# Altium schematic sheet power.SchDoc
size B
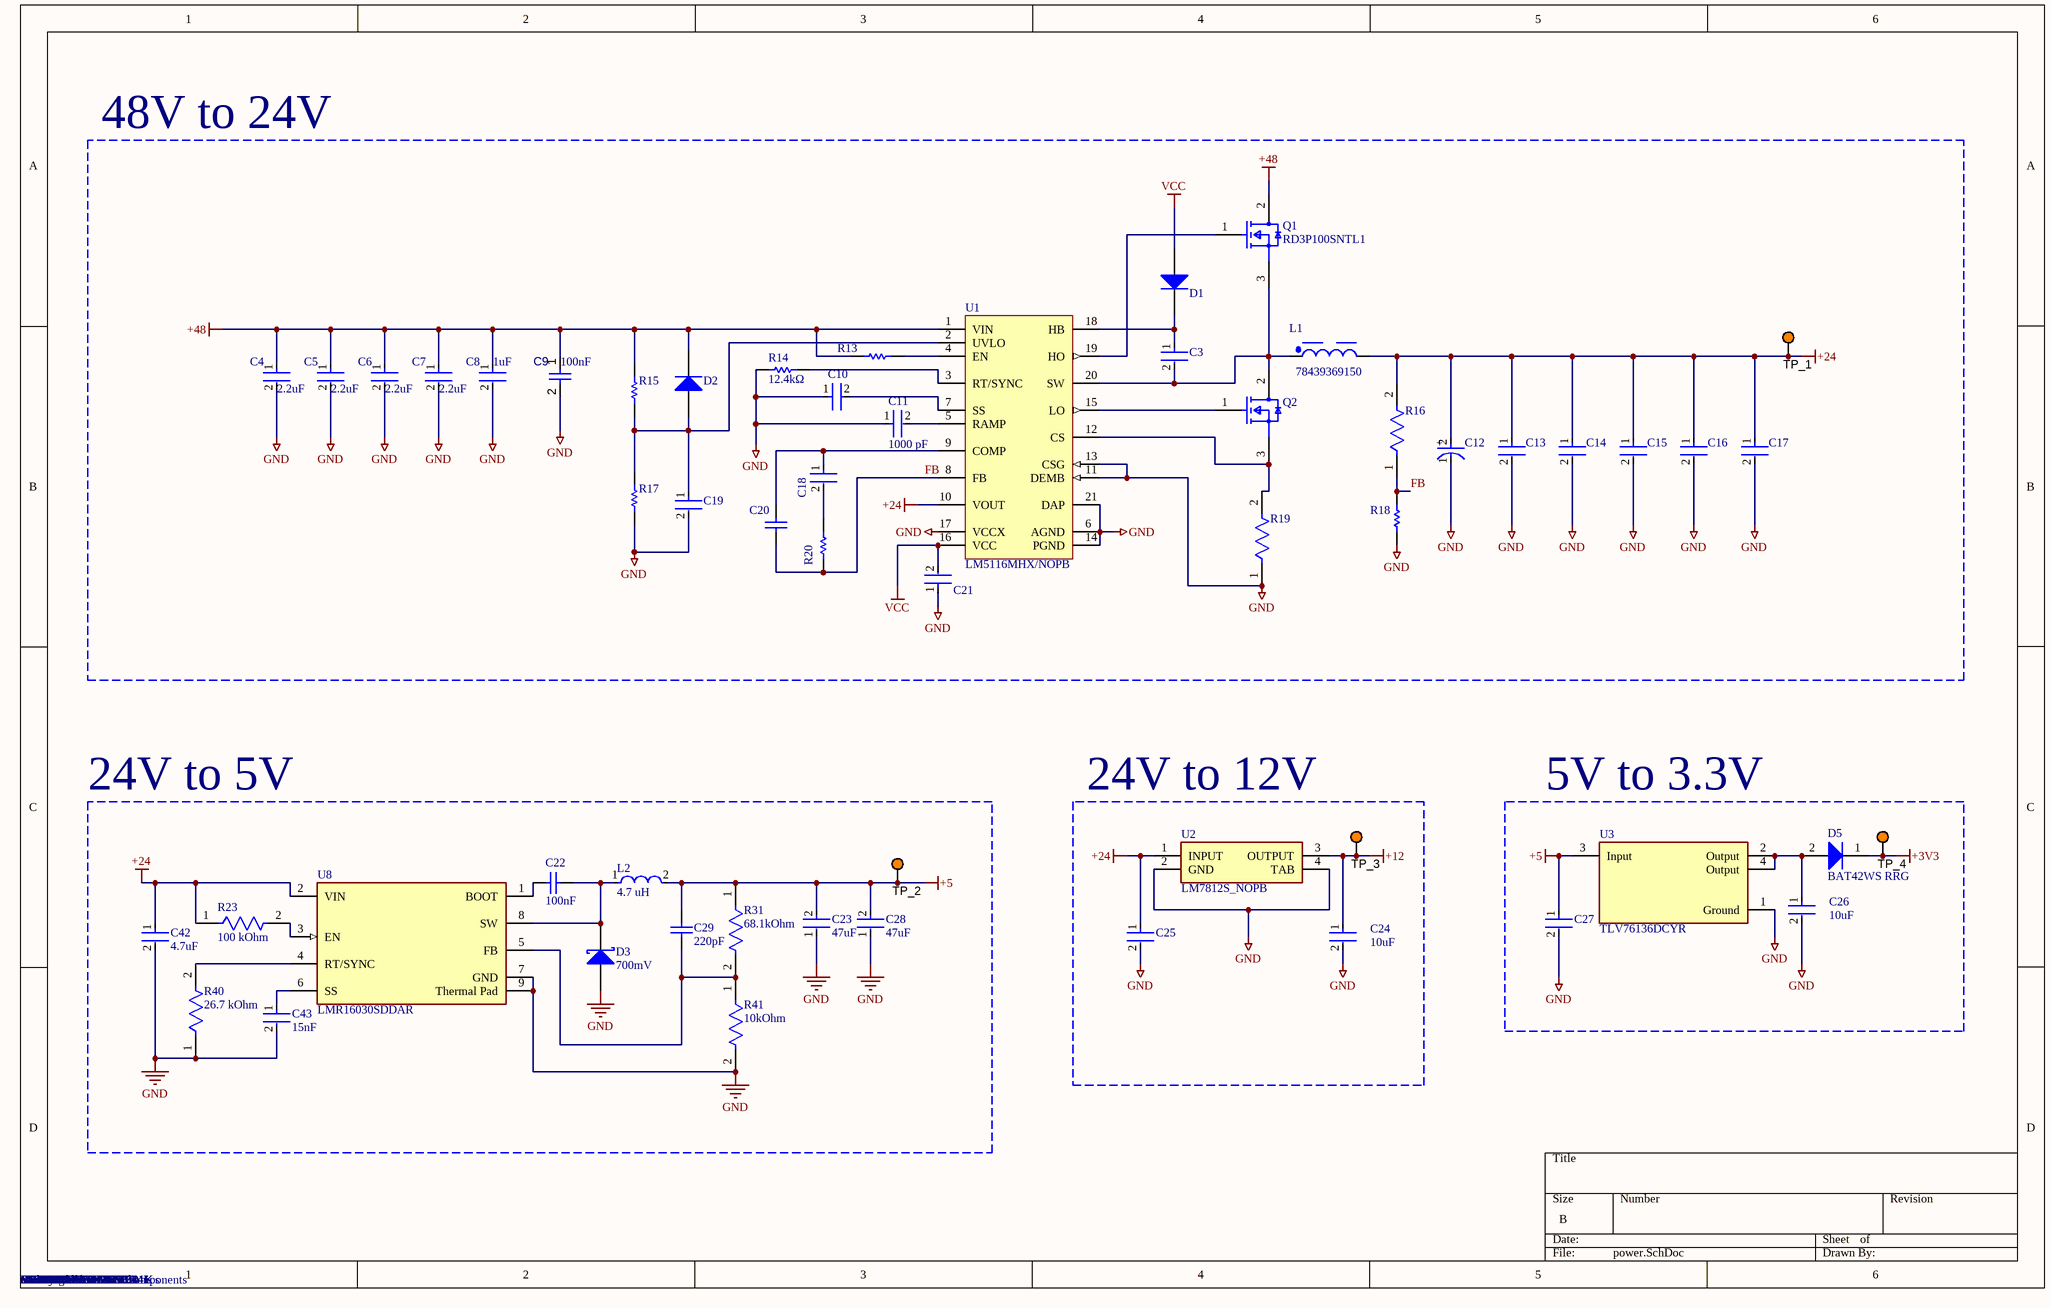
[diagram p0: power.SchDoc]

## Parts
C3  UMK107AB7105KA-T  [FP-0603-L_1_6_0_15-W_0_8-IPC_C]  (value not drawn)
C4  2.2uF  Manufacturer: Murata Electronics  Manufacturer Part Number: GRM21BD72A225ME01K  [FP-GRM21B-0_2-e0_2_0_7-IPC_B]
C5  2.2uF  Manufacturer: Murata Electronics  Manufacturer Part Number: GRM21BD72A225ME01K  [FP-GRM21B-0_2-e0_2_0_7-IPC_B]
C6  2.2uF  Manufacturer: Murata Electronics  Manufacturer Part Number: GRM21BD72A225ME01K  [FP-GRM21B-0_2-e0_2_0_7-IPC_B]
C7  2.2uF  Manufacturer: Murata Electronics  Manufacturer Part Number: GRM21BD72A225ME01K  [FP-GRM21B-0_2-e0_2_0_7-IPC_B]
C8  Capacitance: 1uF  [FP-C1210C105K1RACTU-MFG]  (hidden comment: C1210C105K1RACTU)
C9  value 100nF  [CAPC1608X90N]  (hidden comment: CL10B104KC8NNNC)
C10  CL10B104KC8NNNC  [FP-CL10-IPC_A]  (value not drawn)
C11  1000 pF  [FP-C0603C-CF-MFG]
C12  Manufacturer: Panasonic Electronic Components  [FP-OS-CON-SMT-C6-MFG]  (hidden comment: 50SVPK10M)
C13  885012108022  [FP-CL31-IPC_C]  (value not drawn)
C14  885012108022  [FP-CL31-IPC_C]  (value not drawn)
C15  885012108022  [FP-CL31-IPC_C]  (value not drawn)
C16  885012108022  [FP-CL31-IPC_C]  (value not drawn)
C17  885012108022  [FP-CL31-IPC_C]  (value not drawn)
C18  C0603C332J5RACTU  [FP-C0603C-CF-MFG]  (value not drawn)
C19  UMK107AB7105KA-T  [FP-0603-L_1_6_0_15-W_0_8-IPC_C]  (value not drawn)
C20  CC0603JRNPO9BN101  [CAPC1608X90X40ML10T20]  (value not drawn)
C21  UMK107AB7105KA-T  [FP-0603-L_1_6_0_15-W_0_8-IPC_C]  (value not drawn)
C22  100nF  Manufacturer: Samsung Electro-Mechanics  Manufacturer Part Number: CL10B104KC8NNNC  [CAPC0603(1608)100_L]
C23  47uF  Manufacturer: Murata Electronics  Manufacturer Part Number: GRM31CR61C476ME44L  [FP-GRM31C-0_3-e0_3_0_8-IPC_C]
C24  Capacitance: 10uF  [FP-GRT188-0_2-MFG]  (hidden comment: GRT188R61E106ME13D)
C25  UMK107AB7105KA-T  [FP-0603-L_1_6_0_15-W_0_8-IPC_C]  (value not drawn)
C26  Capacitance: 10uF  [FP-GRT188-0_2-MFG]  (hidden comment: GRT188R61E106ME13D)
C27  UMK107AB7105KA-T  [FP-0603-L_1_6_0_15-W_0_8-IPC_C]  (value not drawn)
C28  47uF  Manufacturer: Murata Electronics  Manufacturer Part Number: GRM31CR61C476ME44L  [FP-GRM31C-0_3-e0_3_0_8-IPC_C]
C29  220pF  [CAPC1608X92X38LL15T08]
C42  4.7uF  Manufacturer: KEMET  Manufacturer Part Number: C1206C475K5RACTU  [FP-GRJ31C-0_3-IPC_B]
C43  15nF  [FP-C0603C-CF-MFG]
D1  LL4148  [FAIR-SOD80-2_V]  (value not drawn)
D2  LL4148  [FAIR-SOD80-2_V]  (value not drawn)
D3  700mV  Manufacturer Part Number: B560C-13-F  [DIOD-B5X0C-2_M]
D5  BAT42WS RRG  [BAT42WS RRG-Footprint-1]
L1  78439369150  [WE-XHMA_1090]
L2  4.7 uH  Manufacturer: Vishay Dale  Manufacturer Part Number: IHLP2020CZER4R7M11  [FP-IHLP-2020CZ-FP_1_905x2-MFG]
Q1  RD3P100SNTL1  [DPAK230P990X240-3N]
Q2  DMT10H009LK3-13  [DPAK229P991X239-3N]  (value not drawn)
R13  RC0603FR-071ML  [RESC1608X55X25LL10T15]  (value not drawn)
R14  value 12.4kΩ  [FP-RC0603-0_55-IPC_C]  (hidden comment: RC0603FR-0712K4L)
R15  ERJ-3EKF6192V  [RESC1608X55X30ML15T15]  (value not drawn)
R16  RT0603BRE0726K7L  [FP-RT0603-MFG]  (value not drawn)
R17  ERJ-3EKF3921V  [RESC1608X55X30LL15T15]  (value not drawn)
R18  ERJ-3EKF1431V  [RESC1608X55X30ML15T15]  (value not drawn)
R19  PA2512FKE7W0R007E  [FP-PA2512E-R007-0R10-MFG]  (value not drawn)
R20  ERJ3EKF1802V  [RESC1608X55X30LL15T15]  (value not drawn)
R23  100 kOhm  Manufacturer: YAGEO  Manufacturer Part Number: RC0603FR-07100KL  [FP-AC0603-MFG]
R31  68.1kOhm  Manufacturer: YAGEO  Manufacturer Part Number: RC0603FR-0768K1L  [FP-CRCW0603-e3-IPC_B]
R40  26.7 kOhm  Manufacturer: Vishay Dale  Manufacturer Part Number: CRCW060326K7FKEA  [FP-AC0603-IPC_B]
R41  10kOhm  Manufacturer: YAGEO  Manufacturer Part Number: RC0603FR-0710KL  [FP-MCT0603-IPC_B]
TP_1  5003  [KSTN-5003]  (value not drawn)
TP_2  5003  [KSTN-5003]  (value not drawn)
TP_3  5003  [KSTN-5003]  (value not drawn)
TP_4  5003  [KSTN-5003]  (value not drawn)
U1  LM5116MHX/NOPB  [PWP0020A_M]
U2  LM7812S_NOPB  [KTT0003B]
U3  TLV76136DCYR  [TLV76136DCYR-Footprint-1]
U8  LMR16030SDDAR  [FP-DDA0008E-IPC_A]

## Blocks framed on the sheet
48V to 24V: C3-C21 D1 D2 L1 Q1 Q2 R13-R20 TP_1 U1
24V to 5V: C22 C23 C28 C29 C42 C43 D3 L2 R23 R31 R40 R41 TP_2 U8
24V to 12V: C24 C25 TP_3 U2
5V to 3.3V: C26 C27 D5 TP_4 U3

## Nets
+3V3: D5.1(K) TP_4.1
+5: C23.2 C27.1 C28.2 C29.2 L2.2 R31.1 TP_2.1 U3.3(Input)
+12: C24.1 TP_3.1 U2.3(OUTPUT)
+24: C12.2(A) C13.1 C14.1 C15.1 C16.1 C17.1 C25.1 C42.1 L1.2 R16.2 R23.1 TP_1.1 U1.10(VOUT) U2.1(INPUT) U8.2(VIN)
+48: C4.1 C5.1 C6.1 C7.1 C8.1 C9.1 D2.2(K) Q1.2 R13.1 R15.2 U1.1(VIN)
GND: C4.2 C5.2 C6.2 C7.2 C8.2 C9.2 C10.1 C11.1 C12.1(C) C13.2 C14.2 C15.2 C16.2 C17.2 C19.2 C21.1 C23.1 C24.2 C25.2 C26.2 C27.2 C28.1 C42.2 C43.2 D3.2(A) R14.1 R17.1 R18.1 R19.1 R40.1 R41.2 U1.6(AGND) U1.11(DEMB) U1.13(CSG) U1.14(PGND) U1.17(VCCX) U1.21(DAP) U2.2(GND) U2.4(TAB) U3.1(Ground) U8.7(GND) U8.9(Thermal_Pad)
VCC: C21.2 D1.1(A) U1.16(VCC)
FB: C20.1 R16.1 R18.2 R20.1 U1.8(FB)
NetC3_1: C3.1 D1.2(K) U1.18(HB)
NetC3_2: C3.2 L1.1 Q1.3 Q2.2(D) U1.20(SW)
NetC10_2: C10.2 U1.7(SS)
NetC11_2: C11.2 U1.5(RAMP)
NetC18_1: C18.1 C20.2 U1.9(COMP)
NetC18_2: C18.2 R20.2
NetC19_1: C19.1 D2.1(A) R15.1 R17.2 U1.2(UVLO)
NetC22_1: C22.1 U8.1(BOOT)
NetC22_2: C22.2 D3.1(K) L2.1 U8.8(SW)
NetC26_1: C26.1 D5.2(A) U3.2(Output) U3.4(Output)
NetC29_1: C29.1 R31.2 R41.1 U8.5(FB)
NetC43_1: C43.1 U8.6(SS)
NetQ1_1: Q1.1(Gate) U1.19(HO)
NetQ2_1: Q2.1(G) U1.15(LO)
NetQ2_3: Q2.3(S) R19.2 U1.12(CS)
NetR13_2: R13.2 U1.4(EN)
NetR14_2: R14.2 U1.3(RT/SYNC)
NetR23_2: R23.2 U8.3(EN)
NetR40_2: R40.2 U8.4(RT/SYNC)

## Notes on the sheet
- (in symbol CMP-05428-000804-1) +

## Library data of the parts
C3 C19 C21 C25 C27 = CMP-2000-07531-4: Ceramic Capacitor General Use 1uF ±10% 50V X7R 0603; Series: M; Width: 0.031inch; Mount: Surface Mount; Radiation Hardening: No; Voltage Rating (DC): 50V; Packaging: Tape and Reel; Termination: SMD/SMT; Depth: 0.8mm; Case Code (Metric): 1608; Case Code (Imperial): 0603; Height: 0.8mm; Voltage Rating: 50V; Package Quantity: 1; Halogen Free: Halogen Free; Dielectric: X7R; Min Operating Temperature: -55°C; Length: 1.6mm; Construction: Flat; Tolerance: 10%; Thickness: 0.037inch; Max Operating Temperature: 125°C; Case/Package: 0603; Capacitance: 1uF; RoHS Compliant: Yes
C4-C7 = CMP-06035-063309-1: CAP CER 2.2UF 100V X7T 0805
C8 = CMP-03020-034669-1: CAP CER 1UF 100V X7R 1210; Dielectric Material: Ceramic; Tolerance: 10%; Height: 1.7mm; Voltage Rating: 100V; Termination: SMD/SMT; Depth: 2.5mm; Construction: Flat; REACH SVHC: No SVHC; Length: 3.2mm; Case Code (Imperial): 1210; Radiation Hardening: No; Case/Package: 1210; Case Code (Metric): 3225; Mount: Surface Mount; Package Quantity: 1; Voltage Rating (DC): 100V; Min Operating Temperature: -55°C; Voltage: 100V; Thickness: 0.075inch; Width: 0.098inch; Max Operating Temperature: 125°C; Packaging: Tape and Reel; Series: C; RoHS Compliant: Yes; Number of Pins: 2; Dielectric: X7R
C9 = CMP-001-00090-1: Ceramic Capacitor, Multilayer, Ceramic, 100V, 10% +Tol, 10% -Tol, X7R, 15% TC, 0.1uF, Surface Mount, 0603; Case/Package: 0603; Min Operating Temperature: -55°C; Mounting Technology: Surface Mount; Capacitor Type: Ceramic; Max Operating Temperature: 125°C; Pins: 2; RoHS Compliant: Yes
C10 = CMP-13271-004036-1: Cap Ceramic 100nF 100V X7R ±10% Pad SMD 0603 +125°C T/R; Mount: Surface Mount; Packaging: Cut Tape; Width: 0.031inch; Thickness: 0.035inch; Length: 0.063inch; Tolerance: 10%; Min Operating Temperature: -55°C; Case/Package: 0603; Voltage Rating: 100V; Max Operating Temperature: 125°C; Case Code (Metric): 1608; Capacitance: 100nF; Case Code (Imperial): 0603
C11 = CMP-2006-03022-3: CAP CER 1000PF 50V X7R 0603; Manufacturer Part Number: C0603C102K5RACTU; Manufacturer: KEMET; Automotive Grade: Grade 1; Tolerance: 0.1; Value: 1,000 pF; Temperature Coefficient: 30ppm/°C; Material: Ceramic; Temperature Characteristic: X7R; ComponentLink2URL: https://api.kemet.com/component-edge/download/datasheet/C0603C100J5GACAUTO.pdf; Temperature Range Low: -55°C; Capacitance: 1,000 pF; Device Class L2: Capacitors; Device Class L3: Ceramic Capacitors; Device Class L1: Passive Components; Temperature Range High: +125°C; Digikey Description: CAP CER 1000PF 50V X7R 0603; Temperature: -55°C to +125°C; Voltage Rating: 50 V; Mouser Description: Capacitor; Ceramic; Cap; 1000pF; Tol 10%; SMT; Vol-Rtg 50V; X7R; Tape and Reel; Automotive: Yes; RoHS: TRUE; Octopart: https://octopart.com/c0603c102k5ractu-kemet-144878; Height: 0.87mm; Package: C0603C-CF; Lead Free: Yes; Category: Cap; ComponentLink2Description: Datasheet
C12 = CMP-05428-000804-1: Conductive Polymer Aluminum Solid Capacitors (OS-CON) 10uF ±20% 50V; ESR (Equivalent Series Resistance): 40mR; Ripple Current: 2.5A; Leakage Current: 100uA; Life (Hours): 5000Hour; Dissipation Factor: 12%; Voltage Rating (DC): 50V; Termination: SMD/SMT; Voltage Rating: 50V; Voltage: 50V; Min Operating Temperature: -55°C; Max Operating Temperature: 105°C; Height - Seated (Max): 0.236inch; Case/Package: Radial; Mount: Surface Mount; Height: 5.9mm; RoHS Compliant: Yes; Diameter: 6.3mm; Construction: Cylindrical; Ripple Current (AC): 2.5A; Series: OS-CON, SVPF; Length: 5.9mm; Package Quantity: 1000; REACH SVHC: No SVHC; Number of Pins: 6; Capacitance: 10uF; Packaging: Tape and Reel; Lead Free: Lead Free; Tolerance: 20%; Manufacturer Part Number: 50SVPK10M
C13-C17 = CMP-13271-000016-1: CAP CER 10UF 50V X5R 1206; Manufacturer: Wurth Elektronik; Tolerance: 10%; Material: Ceramic; Temperature Coefficient: 15%; RoHS: TRUE; Ipc Land Pattern Name: CAPC320160X160; Temperature Range Low: -55°C; Value: 10uF; Device Class L3: Ceramic Capacitors; Category: Cap; Temperature Characteristic: X5R; Lead Free: Yes; Device Class L2: Capacitors; Octopart: https://octopart.com/cl31a106kbhnnne-samsung-19832778; ComponentLink2Description: Datasheet; Digikey Description: CAP CER 10UF 50V X5R 1206; Voltage: 50V; ComponentLink2URL: http://www.samsungsem.com/kr/support/product-search/mlcc/__icsFiles/afieldfile/2018/06/21/CL31A106KBHNNNE.pdf; Capacitance: 10uF; Manufacturer Part Number: 885012108022; Temperature Range High: +85°C; Device Class L1: Passive Components; Height: 1.8mm; Automotive: No; Voltage Rating: 50V; Package: CL31; Temperature: -55°C to +85°C
C18 = CMP-2006-03174-2: CAP CER 3300PF 50V 5% X7R 0603; Manufacturer: KEMET; Automotive Grade: Grade 1; Material: Ceramic; Value: 3,300 pF; Temperature Coefficient: 30ppm/°C; Tolerance: 0.05; Temperature Range Low: -55°C; Device Class L3: Ceramic Capacitors; Temperature Characteristic: X7R; Temperature: -55°C to +125°C; Device Class L1: Passive Components; ComponentLink2URL: https://api.kemet.com/component-edge/download/datasheet/C0603C100J5GACAUTO.pdf; Automotive: Yes; Capacitance: 3,300 pF; RoHS: TRUE; Mouser Description: Multilayer Ceramic Capacitors MLCC - SMD/SMT 50volts 3300pF X7R 5%; Height: 0.87mm; Manufacturer Part Number: C0603C332J5RACTU; Temperature Range High: +125°C; ComponentLink2Description: Datasheet; Voltage Rating: 50 V; Octopart: https://octopart.com/c0603c332j5ractu-kemet-9139905; Package: C0603C-CF; Lead Free: Yes; Device Class L2: Capacitors; Digikey Description: CAP CER 3300PF 50V 5% X7R 0603; Category: Cap
C20 = CMP-2100-03594-1: Chip Capacitor, 100 pF, +/- 5%, 50 V, -55 to 125 degC, 0603 (1608 Metric), RoHS, Tape and Reel; Manufacturer: Yageo; Capacitance: 100pF; Voltage Rating (DC): 50V; Dielectric: C0G; Temperature Coefficient: 30ppm/degC; Insulation Resistance: 100GR; Datasheet Version: Rev. 14, 07/2016; Manufacturer URL: http://www.yageo.com/; Packaging: TapeandReel; Mount: SurfaceMount; RoHSCompliant: True; Package Reference: 0603; Tolerance: 5%; Max Operating Temperature: 125degC; Case Code (Imperial): 0603; Number of Pins: 2; Width: 0.8mm; Case Code (Metric): 1608; Voltage: 50V; REACH SVHC: Unknown; Package Description: 2-Pin Surface Mount Device, Body 1.6 x 0.8 mm; Composition: Ceramic; Lead Free: LeadFree; Min Operating Temperature: -55degC; Radiation Hardening: No; Depth: 0.8mm; Thickness: 0.035inch; Datasheet URL: http://www.yageo.com/documents/recent/UPY-GP_NP0_16V-to-50V_14.pdf; Termination: SMD/SMT; Package Quantity: 1; Length: 1.6mm; Voltage Rating: 50V; Height: 0.8mm; Case/Package: 0603
C22 = CMP-1035-02579-1: CAP 100nF 10V ±5% 0603 (1608 Metric) Thickness 1mm SMD; Tolerance: Â±5%; Case-EIA: 0603; Case-Metric: 1608; Value: 100nF; Max Thickness: 1 mm; Rated Voltage: 10 V; Technology: SMT
C23 C28 = CMP-06035-011430-1: Chip Multilayer Ceramic Capacitors for General Purpose, 1206, 47uF, X5R, 15%, 20%, 16V; Capacitance: 47uF; Length: 3.2mm; Thickness: 1.6mm; Width: 1.6mm; Voltage Rating (DC): 16V; Tolerance: 20%; Dielectric: X5R
C24 C26 = CMP-06035-032378-1: Multi-Layer Ceramic Capacitor 10uF 25V X5R ±20% 0603 Paper T/R; Thickness: 0.035inch; Case/Package: 0603; Voltage Rating: 25V; Mount: Surface Mount; Packaging: Tape and Reel; Width: 0.031inch; Max Operating Temperature: 85°C; Case Code (Imperial): 0603; Ratings: AEC-Q200; Tolerance: 20%; Min Operating Temperature: -55°C; Case Code (Metric): 1608; Length: 0.063inch
C29 = CMP-2006-01352-1: Part Number: VJ0603A221FXAAC; Manufacturer: Vitramon
C42 = CMP-06035-062583-1: CAP CER 4.7UF 50V X7R 1206; Tolerance: 20%; Voltage Rating: 50V; RoHS Compliant: Yes; Case Code (Imperial): 1206; Max Operating Temperature: 125°C; Case/Package: 1206; Case Code (Metric): 3216; Packaging: Cut Tape; Capacitance: 4.7uF; Features: Soft Termination; Mount: Surface Mount; Min Operating Temperature: -55°C
C43 = CMP-03020-007032-1: C0603 15,000 pF X7R 30ppm/°C 5.00% 50 V; Manufacturer Part Number: C0603C153J5RACAUTO; Manufacturer: KEMET; Material: Ceramic; Voltage Rating: 50 V; Tolerance: 0.05; Automotive Grade: Grade 1; Device Class L2: Capacitors; Temperature Range High: +125°C; Device Class L3: Ceramic Capacitors; RoHS: TRUE; Capacitance: 15,000 pF; Automotive: Yes; ComponentLink2URL: https://api.kemet.com/component-edge/download/datasheet/C0603C100J5GACAUTO.pdf; ComponentLink2Description: Datasheet; Package: C0603C-CF; Temperature Characteristic: X7R; Temperature Coefficient: 30ppm/°C; Height: 0.87mm; Lead Free: Yes; Device Class L1: Passive Components; Octopart: https://octopart.com/c0603c153j5racauto-kemet-88369026; Temperature Range Low: -55°C; Category: Cap; Temperature: -55°C to +125°C; Value: 15,000 pF
D1 D2 = CMP-2000-05115-2: Small Signal Diode, 100 V, 0.2 A, -55 to 175 degC, 2-Pin SOD80, RoHS, Tape and Reel; Manufacturer: Fairchild; Reverse Voltage-Max [Vrrm]: 100V; Average Forward Current-Max: 200mA; Forward Voltage: 1V; Reverse Recovery Time-Max: 1ns; Power Dissipation: 500mW; Datasheet URL: https://www.fairchildsemi.com/datasheets/LL/LL4148.pdf; Manufacturer URL: https://www.fairchildsemi.com/; Datasheet Version: Rev. 1.8, 01/2016
D3 = CMP-2000-05098-2: Schottky Barrier Rectifier, 5 A, 60 V, -55 to 125 degC, 2-Pin SMD, RoHS, Tape and Reel; Manufacturer: Diodes Incorporated; Ir - Reverse Current: 500uA; Configuration: Single; Ifsm - Forward Surge Current: 100A; Vrrm - Repetitive Reverse Voltage: 60V; Brand: DiodesIncorporated; Vf - Forward Voltage: 0.7V; If - Forward Current: 5A; Unit Weight: 0.007408oz; Type: SchottkyBarrierRectifier; Package / Case: SMC; Manufacturer URL: http://www.diodes.com/; Datasheet URL: https://datasheet.ciiva.com/27052/1538961-27052355.pdf; Factory Pack Quantity: 3000; Height: 2.5mm; Width: 6.22mm; Product Category: SchottkyDiodes&Rectifiers; Minimum Operating Temperature: -55C; Datasheet Version: Rev. 7-2, 06/2007; Product: SchottkyDiodes; Maximum Operating Temperature: +125C; Operating Temperature Range: -55Cto+125C; Technology: Si; Length: 7.11mm; RoHS: True; Packaging: Reel; Termination Style: SMD/SMT; Series: B560; Mounting Style: SMD/SMT
D5 = CMP-004-00032-1: Schottky Diode, 30V, 0.2A, Sod-323F Rohs Compliant: Yes; Manufacturer Lifecycle Status: ACTIVE; Lifecycle Status: Production
L1 = CMP-03913-127637946-2: Inductor, Aec-Q200, 15Uh, Shielded, 8.3A Rohs Compliant: Yes; DC Resistance (DCR): 14.8mΩ; Inductance: 15µH; Saturation Current: 7.2A; Ambient Temperature Range High: 85°C; Width: 10.5mm; RoHS: Compliant; Length: 11.6mm; Ambient Temperature Range Low: -40°C; Min Operating Temperature: -40°C; Height: 9.1mm; Max Operating Temperature: 125°C
L2 = CMP-02424-000570-1: Fixed Inductors Commercial Low DCR Series 4.7uH 4.5A 60mΩ 20%; DC Resistance (DCR): 60mR; Saturation Current: 5.2A; Test Frequency: 100kHz; Shielding: Shielded; RMS Current (Irms): 3.5A; Resistance: 54mR; Core Material: Metal; Self Resonant Frequency: 27MHz; Tolerance: 20%; Case/Package: 2020; Termination: SMD/SMT; Width: 5.18mm; Inductance Tolerance: 20%; Max Operating Temperature: 125°C; Number of Pins: 2020; Radiation Hardening: No; Packaging: Tape and Reel; Lead Free: Lead Free; Min Operating Temperature: -55°C; Package Quantity: 2000; Length: 5.49mm; Military Standard: Not; Current Rating: 4.5A; Height - Seated (Max): 0.118inch; Inductance: 4.7uH; Height: 3mm; Max DC Current: 5.2A; Depth: 5.43mm; Mount: Surface Mount
Q1 = CMP-013-00035-2: Transistor MOSFET N-CH 100V 10A 3-Pin TO-252 Emboss T/R; Number of Elements: 1; Drain to Source Resistance: 147mΩ; Min Breakdown Voltage: 100V; Continuous Drain Current (ID): 10A; RoHS: Compliant; REACH SVHC: No; Lifecycle Status: Production; Number of Terminals: 2; Mounting Technology: Surface Mount
Q2 = CMP-013-00037-2: DMT10H009LK3 series N-Channel Mosfet 100V 90A TO252 (DPAK); Number of Elements: 1; Drain to Source Resistance: 9mΩ; Max Power Dissipation: 3W; China RoHS: Non-Compliant; Lifecycle Status: Production; Military Standard: MIL-STD-202; Min Operating Temperature: -55°C; REACH SVHC: No; Continuous Drain Current (ID): 90A; Number of Terminals: 2; Min Breakdown Voltage: 100V; RoHS: Compliant; Max Operating Temperature: 150°C
R13 = CMP-1659-00056-1: Chip Resistor, 1 MOhm, +/- 1%, 100 mW, -55 to 155 degC, 0603 (1608 Metric), RoHS, Tape and Reel; Voltage Rating (DC): 25 V; Tolerance: 20%; Case\Package: Radial; Capacitance: 1 mF; Min Operating Temperature: -40 degC; PackageDescription: 2-Pin Surface Mount Device, Body 1.6 x 0.8 mm; ComponentLink1Description: Manufacturer URL; Radiation Hardening: No; DatasheetVersion: Rev. 4, 02/2016; REACH SVHC: No SVHC; Length: 20 mm; Max Operating Temperature: 85 degC; Diameter: 10 mm; Packaging: Bulk; Package Quantity: 200; PackageReference: 0603; Mount: Through Hole; ComponentLink1URL: http://www.yageo.com/; ComponentLink2URL: http://www.yageo.com/documents/recent/PYu-RC_Group_51_RoHS_L_04.pdf; ComponentLink2Description: Datasheet; Width: 0 inch; Lead Pitch: 5 mm; RoHSCompliant: true; Voltage Rating: 25 V; Height: 20 mm
R14 = CMP-009-00181-1: 100mW Thick Film Resistors 75V ±100ppm/℃ ±1% 12.4kΩ 0603 Chip Resistor - Surface Mount ROHS; Temperature Coefficient: 100ppm/°C; Voltage Rating (DC): 50V; Number of Terminals: 2; REACH SVHC: Yes; Depth: 800µm; Min Operating Temperature: -55°C; Max Operating Temperature: 155°C; Termination: SMD/SMT; Mounting Technology: Surface Mount; Width: 800µm; Features: Moisture Resistant; Composition: Thick Film; Working Voltage: 75V; Number of Terminations: 2; Voltage Rating: 75V; Height: 450µm; Case/Package: 0603; Lead Free: Lead Free; China RoHS: Non-Compliant; Tolerance: 1%; Case Code (Imperial): 0603; RoHS: Compliant; Power Dissipation: 100mW; Military Standard: Not; Power Rating: 100mW; Lifecycle Status: Production; Packaging: Tape & Reel; Max Power Dissipation: 100mW; Schedule B: 8533210045, 8533210045; Length: 1.6002mm
R15 = CMP-2000-00591-1: Manufacturer: Panasonic; Part Number: ERJ-3EKF6192V
R16 = CMP-03412-031734-1: RES SMD 26.7K OHM 0.1% 1/10W; Manufacturer: Yageo; Value: 26.7KΩ; Power Rating: 0.1W; Temperature Coefficient: 50 ppm/°C; Tolerance: 0.001; Voltage Rating: 75V; Series: RT; Footprint Url: http://www.yageo.com/exep/pages/download/literatures/PYu-R_Mount_10.pdf; Octopart: https://octopart.com/rt0603bre0726k7l-yageo-1474480; Composition: Thin Film; Automotive: No; Temperature Range Low: -55°C; ComponentLink2URL: http://www.yageo.com/documents/recent/PYu-RT_1-to-0.01_RoHS_L_9.pdf; Height: 0.55mm; Device Class L1: Passive Components; Manufacturer Part Number: RT0603BRE0726K7L; Temperature Range High: +155°C; Resistance: 26.7KΩ; Package: RT0603; Digikey Description: RES SMD 26.7K OHM 0.1% 1/10W; Temperature: -55°C to +155°C; Device Class L3: Chip SMD Resistors; Lead Free: Yes; Category: Res; Ipc Land Pattern Name: RESC16080X45; Device Class L2: Resistors; ComponentLink2Description: Datasheet; RoHS: TRUE
R17 = CMP-2000-00479-1: Manufacturer: Panasonic; Part Number: ERJ-3EKF3921V
R18 = CMP-2000-00250-1: Manufacturer: Panasonic; Part Number: ERJ-3EKF1431V
R19 = CMP-03412-022467-1: METAL CURRENT SENSOR 2512 1% 50P; Manufacturer: Yageo; Value: 7mΩ; Automotive Grade: Grade 0; Power Rating: 2W; Temperature Coefficient: 50ppm/°C; Octopart: https://octopart.com/pa2512fke7w0r007e-yageo-96322223; Automotive: Yes; Height: 0.88mm; Manufacturer Part Number: PA2512FKE7W0R007E; RoHS: TRUE; Series: PA_E; Device Class L2: Resistors; ComponentLink2URL: http://www.yageo.com/documents/recent/PYu-PA_E_51_RoHS_10.pdf; Temperature Range Low: -55°C; Device Class L3: Chip SMD Resistors; Temperature: -55°C to +170°C; ComponentLink2Description: Datasheet; Lead Free: Yes; Category: Res; Ipc Land Pattern Name: RESC635318X63; Resistance: 7mΩ; Device Class L1: Passive Components; Composition: Metal Element; Temperature Range High: +170°C; Tolerance: 1%; Digikey Description: METAL CURRENT SENSOR 2512 1% 50P; Package: PA2512E-R007-0R10
R20 = CMP-1012-00650-3: Fixed Resistor, Metal Glaze/thick Film, 0.1W, 18000ohm, 75V, 1% +/-Tol, 100ppm/Cel, Surface Mount, 0603; Manufacturer: Panasonic; Part Number: ERJ3EKF1802V
R23 = CMP-03412-022575-2: RES 100KΩ 1.00% 0.1W 0603; Tolerance: 1%; Resistance: 100kR; RoHS Compliant: Yes; Case/Package: 0603
R31 = CMP-02407-004872-1: RES Thick Film, 68.1kΩ, 1%, 0.1W, 100ppm/°C, 0603; Resistance: 68.1kR; Max Power Dissipation: 100mW; Min Operating Temperature: -55°C; Composition: Thick Film; Tolerance: 1%; Radiation Hardening: No; Width: 0.033inch; Number of Terminations: 2; Contact Plating: Tin; Height: 0.02inch; Packaging: Tape and Reel; Lead Free: Lead Free; Military Standard: Not; Package Quantity: 20000; Features: Automotive AEC-Q200; Case/Package: 0603; Temperature Coefficient: 100ppm/°C; Depth: 0.85mm; Max Operating Temperature: 155°C; Length: 0.061inch
R40 = CMP-03412-016864-2: RES 26.7KΩ 1.00% 0.1W 0603; Power Rating: 100mW; Resistance: 26.7kR; Voltage Rating: 50V; Temperature Coefficient: 100ppm/°C; Tolerance: 1%; Max Operating Temperature: 155°C; Termination: SMD/SMT; Case Code (Imperial): 0603; Resistor Type: Thick Film; Case/Package: 0603; RoHS Compliant: Yes; Max Power Dissipation: 100mW; Features: Moisture Resistant; Weight: 7.1E-05oz; Height: 0.022inch; Packaging: Tape and Reel; Case Code (Metric): 1608; Min Operating Temperature: -55°C; Series: AC; Width: 0.8mm; Length: 0.063inch; Number of Terminations: 2
R41 = CMP-02407-001424-1: RES SMD 100 OHM 1% 1/8W 0603; Tolerance: 0.1%; Temperature Coefficient: 25ppm/°C; Resistance: 10kR; Max Power Dissipation: 100mW; Features: Automotive AEC-Q200; Packaging: Tape and Reel; Number of Terminations: 2; Min Operating Temperature: -55°C; Case Code (Metric): 1608; Case Code (Imperial): 0603; Case/Package: 0603; Composition: Thin Film; Max Operating Temperature: 125°C
TP_1-TP_4 = CMP-002-00037-2: Test Point, Orange, Height 4.6 mm, Tail Length 3 mm, 1-Pin THD, RoHS; Manufacturer: Keystone; Colour: Orange; Packaging: Bulk; Package Description: 1-Pin Through Hole Device, Dia 2.54 mm; Pins: 1; Package Reference: 5003; Datasheet Version: Jun-15; Case/Package: 5003; Mounting Technology: TH; Connector Type: TestPoint; Diameter: 2.54mm; Contact Material: Bronze; Datasheet URL: http://keyelco.com/userAssets/file/M65p56.pdf; Manufacturer URL: http://www.keyelco.com/; Package Quantity: 10; Contact Plating: Tin; RoHS Compliant: True
U1 = CMP-0069-01482-3: Wide Range Synchronous Buck Controller, 20-pin TSSOP-EP, Pb-Free; Manufacturer: Texas Instruments; PackageTopMarking: NSUZXYTT*LM5116*MH; PowerWise: Y; CompType: Switcher; ComponentLink1URL: http://www.ti.com/general/docs/lit/getliterature.tsp?genericPartNumber=LM5116&fileType=pdf; PackageReference: PWP0020A; RoHS: Y; PinCount: 20; Code_JEDEC: MO-153-ACT; PackageDescription: Molded TSSOP, Jedec, 6.5 x 4.4 x 0.9mm Body, 20 Lead, 0.65mm Pitch, Exposed Pad; ComponentLink1Description: Datasheet URL
U2 = LM7812S_NOPB: Integrated Circuit; Manufacturer_Name: Texas Instruments; Manufacturer_Part_Number: LM7812S/NOPB; Datasheet Link: http://www.ti.com/lit/gpn/lm7800; Mouser Part Number: 595-LM7812S/NOPB; Mouser Price/Stock: https://www.mouser.co.uk/ProductDetail/Texas-Instruments/LM7812S-NOPB?qs=9V2QonpqdTtBO5BzoGXA0A%3D%3D; Arrow Part Number: LM7812S/NOPB; Arrow Price/Stock: https://www.arrow.com/en/products/lm7812snopb/texas-instruments?utm_currency=USD&region=nac
U3 = CMP-019-00054-3: 1A 16V high-PSRR linear voltage regulator 4-SOT-223 -40 to 125; Manufacturer Lifecycle Status: ACTIVE; Length: 6.5mm; RoHS: Compliant; Thickness: 1.6mm; Width: 3.5mm; Case/Package: SOT-223; Lifecycle Status: Production; Pins: 4; Height: 1.8mm
U8 = CMP-04918-000376-1: IC REG BUCK ADJUSTABLE 3A 8SOPWR; Quiescent Current: 40uA; Lead Free: Lead Free; Max Operating Temperature: 125°C; Min Operating Temperature: -40°C; Number of Pins: 8; RoHS Compliant: Yes